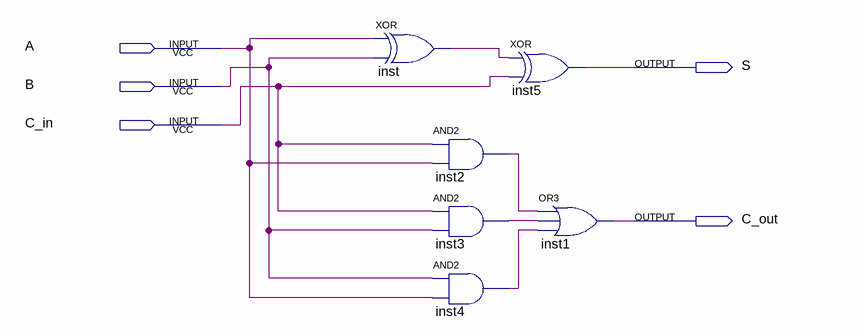
[diagram p0: schematic sheet]
// Quartus schematic Full_adder_1_bit.bdf as structural Verilog: 6 symbols, 5 pins
module Full_adder_1_bit (
  input  A,
  input  B,
  input  C_in,
  output S,
  output C_out
);

  wire inst2_out, inst3_out, inst4_out, inst_out;

  xor inst (inst_out, A, B);
  and inst2 (inst2_out, C_in, A);
  and inst3 (inst3_out, C_in, B);
  and inst4 (inst4_out, B, A);
  xor inst5 (S, inst_out, C_in);
  or inst1 (C_out, inst2_out, inst3_out, inst4_out);
endmodule
